# Altium project ADCS_Prototype.PrjPcb (part 2 of 2)

## Sheet Conversion3V3.SchDoc
size A3; SheetNumber: 5; SheetTotal: 9
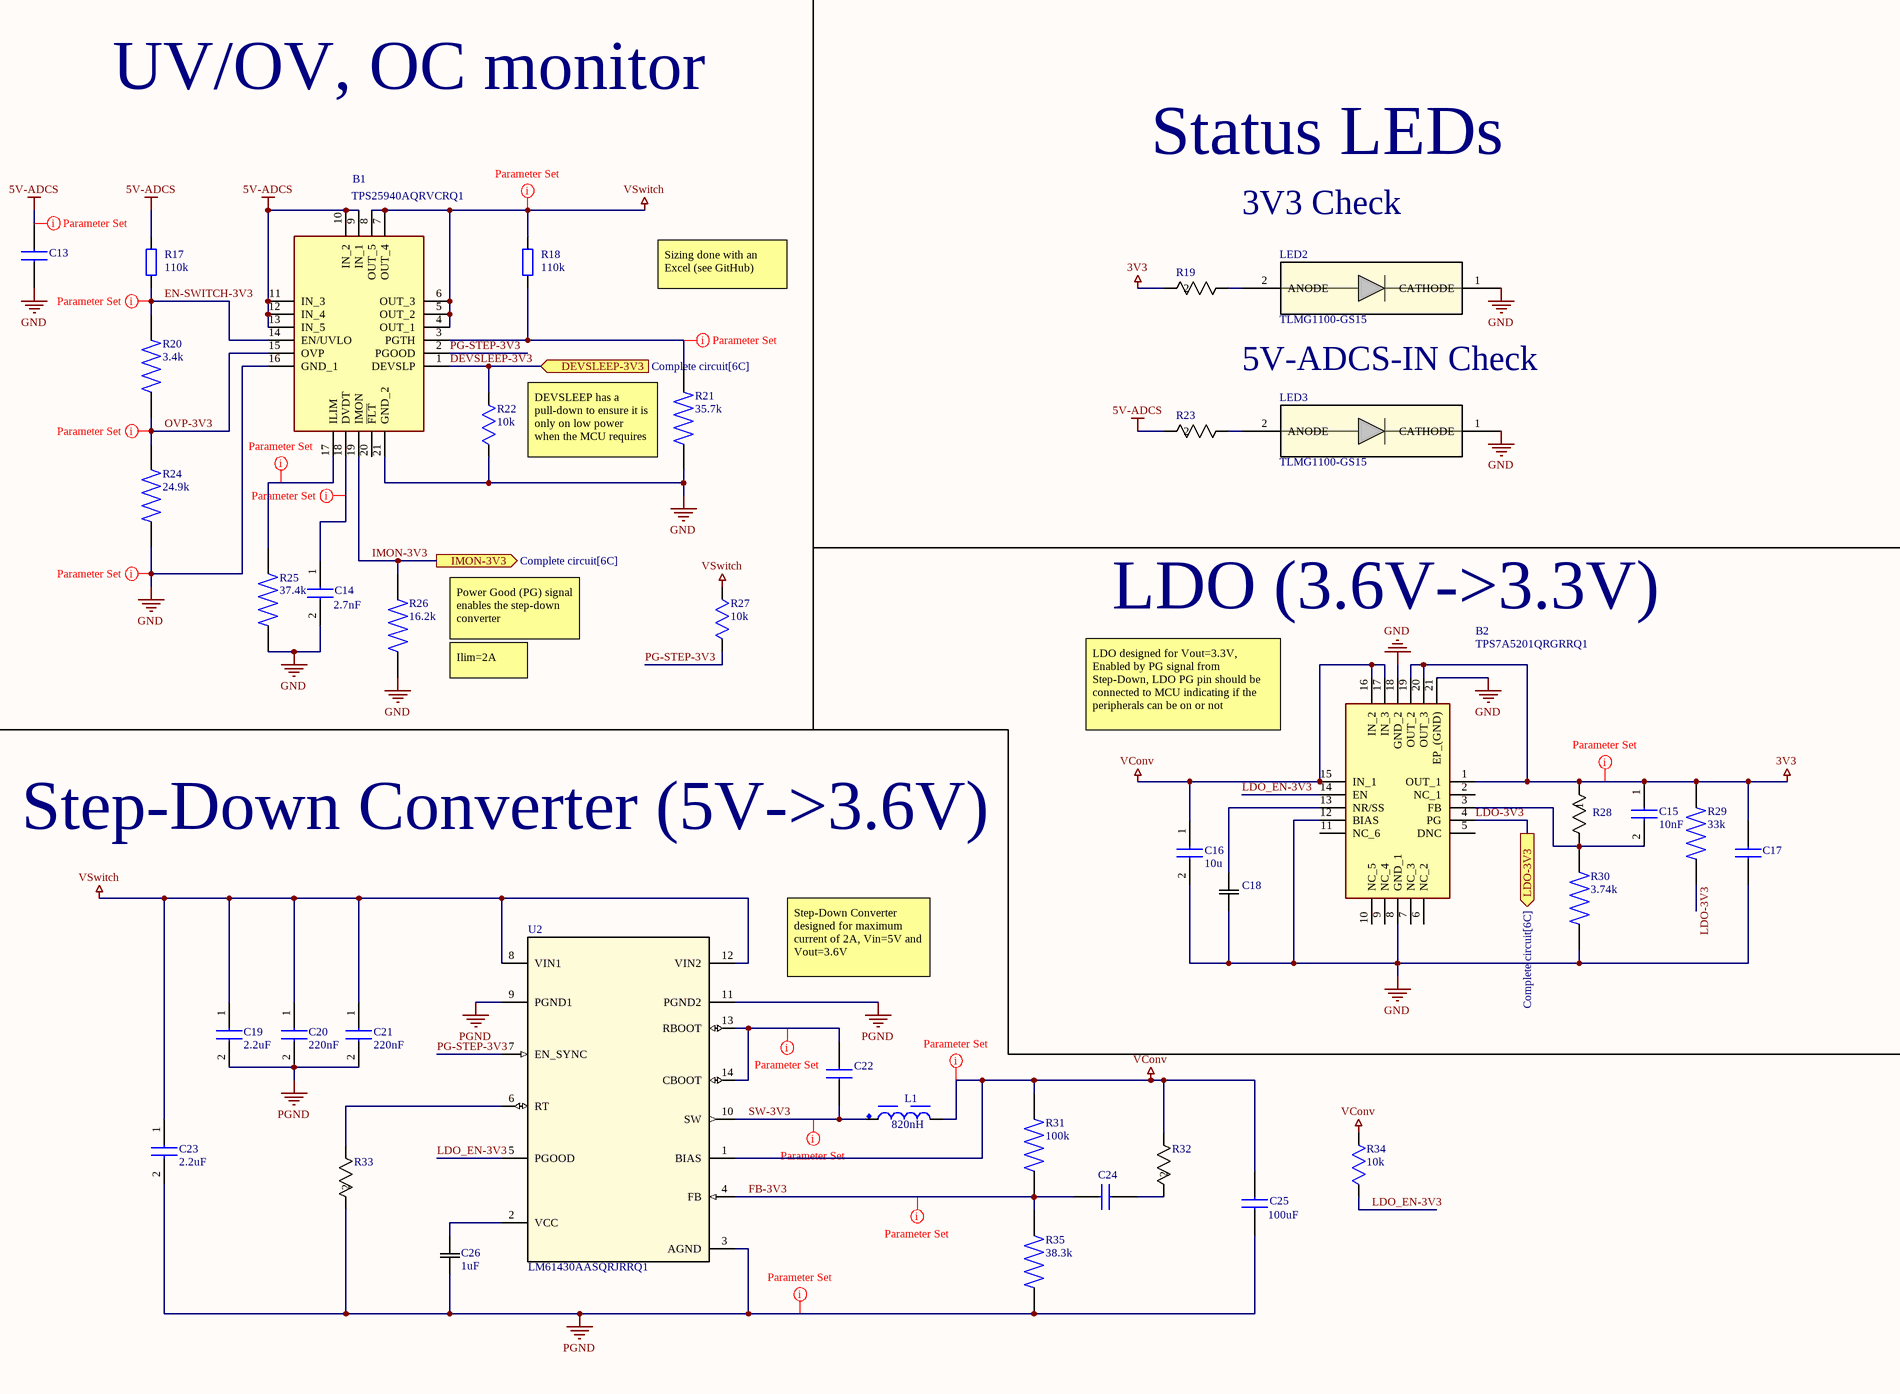
[diagram p7: Conversion3V3.SchDoc, right]

### Parts
B1  TPS25940AQRVCRQ1  [QFN50P300X400X80-21N]
B2  TPS7A5201QRGRRQ1  [QFN50P350X350X100-21N-D]
C13  C1206C104K3GACAUTO  [CAPC3216X180N]  (value not drawn)
C14  Capacitance: 2.7nF  [GCM188]  (hidden comment: GCM1885C1H272FA16J)
C15  Capacitance: 10nF  [C0805]  (hidden comment: C0805X103F5GACAUTO)
C16  Capacitance: 10u  [C0805]  (hidden comment: C0805X106J8RACAUTO)
C17  GCM31CR71A226KE02L  [CAPC3116X180N]  (value not drawn)
C18  C0603X103F3GACAUTO  [CAPC17795_95N_KEM]  (value not drawn)
C19  Capacitance: 2.2uF  [C0805]  (hidden comment: C0805X225J4RECAUTO)
C20  Capacitance: 220nF  [C1210_FT]  (hidden comment: C1210X224J3GACAUTO)
C21  Capacitance: 220nF  [C1210_FT]  (hidden comment: C1210X224J3GACAUTO)
C22  C1206C104K3GACAUTO  [CAPC3216X180N]  (value not drawn)
C23  Capacitance: 2.2uF  [C0805]  (hidden comment: C0805X225J4RECAUTO)
C24  06035A220F4T2A  [CAPC1608X90N]  (value not drawn)
C25  Capacitance: 100uF  [GRT32ER60J107ME13L]  (hidden comment: GRT32ER60J107ME13L)
C26  Capacitance: 1uF  [CAPC18095_95N_KEM]  (hidden comment: C0603X105J4RACAUTO)
L1  value 820nH  [WE-XHMI_4020]  (hidden comment: WE-XHMI_4020)
LED2  TLMG1100-GS15  [LED_0603_VIS]
LED3  TLMG1100-GS15  [LED_0603_VIS]
R17  value 110k  [WRIS-RSKS_0603_Reflow]  (hidden comment: 560112116148)
R18  value 110k  [WRIS-RSKS_0603_Reflow]  (hidden comment: 560112116148)
R19  MCT0603MD7502BP100  [RES_MCT_0603_VIS]  (value not drawn)
R20  value 3.4k  [RESC1508X60N]  (hidden comment: RQ73C1J3K4BTD)
R21  value 35.7k  [RES_ERJ-PB3B3572V]  (hidden comment: ERJ-PB3B3572V)
R22  value 10k  [RES_ERA3ARB103V]  (hidden comment: ERA3ARB103V)
R23  MCT0603MD7502BP100  [RES_MCT_0603_VIS]  (value not drawn)
R24  value 24.9k  [RESC1508X50N]  (hidden comment: RNCP0603FTD24K9)
R25  value 37.4k  [RESC1508X50N]  (hidden comment: RNCP0603FTD37K4)
R26  value 16.2k  [RESC1508X55N]  (hidden comment: RMCF0603FT16K2)
R27  value 10k  [RES_ERA3ARB103V]  (hidden comment: ERA3ARB103V)
R28  TNPW080511K8BEEN  [RES_TNPW0805_VIS]  (value not drawn)
R29  value 33k  [RESC1608X55N]  (hidden comment: RN73R1JTTD3302F10)
R30  value 3.74k  [RESC2012X55N]  (hidden comment: TNPW08053K74DEEA)
R31  value 100k  [RESC1608X55N]  (hidden comment: TNPU0603100KAZEN00)
R32  CRCW06031K00FKEA  [RES_CRCW_0603]  (value not drawn)
R33  CRCW06035K76FKEA  [RC0603N_VIS]  (value not drawn)
R34  value 10k  [RES_ERA3ARB103V]  (hidden comment: ERA3ARB103V)
R35  value 38.3k  [RES_ERJPA3F3832V]  (hidden comment: ERJPA3F3832V)
U2  LM61430AASQRJRRQ1  [RJR0014A-MFG]

### Ports
DEVSLEEP-3V3 (in, see Complete circuit[6C]), IMON-3V3 (out, see Complete circuit[6C]), LDO-3V3 (out, see Complete circuit[6C])

### Nets
3V3: B2.1(OUT_1) B2.19(OUT_2) B2.20(OUT_3) C15.1 C17.2 R19.2 R28.1 R29.2  [project net VDD]
5V-ADCS: B1.9(IN_1) B1.10(IN_2) B1.11(IN_3) B1.12(IN_4) B1.13(IN_5) C13.1 R17.1 R23.2
GND: B1.16(GND_1) B1.21(GND_2) B2.8(GND_1) B2.12(BIAS) B2.18(GND_2) B2.21(EP_(GND)) C13.2 C14.2 C16.2 C17.1 C18.1 LED2.1(CATHODE) LED3.1(CATHODE) R21.1 R22.1 R24.1 R25.1 R26.1 R30.1
PGND: C19.2 C20.2 C21.2 C23.2 C25.1 C26.1 R33.2 R35.1 U2.3(AGND) U2.9(PGND1) U2.11(PGND2)
VConv: B2.15(IN_1) B2.16(IN_2) B2.17(IN_3) C16.1 C25.2 L1.2 R31.2 R32.1 R34.2 U2.1(BIAS)
VSwitch: B1.4(OUT_1) B1.5(OUT_2) B1.6(OUT_3) B1.7(OUT_4) B1.8(OUT_5) C19.1 C20.1 C21.1 C23.1 R18.1 R27.1 U2.8(VIN1) U2.12(VIN2)
DEVSLEEP-3V3: B1.1(DEVSLP) R22.2 ; port DEVSLEEP-3V3
EN-SWITCH-3V3: B1.14(EN/UVLO) R17.2 R20.2
FB-3V3: C24.1 R31.1 R35.2 U2.4(FB)
IMON-3V3: B1.19(IMON) R26.2 ; port IMON-3V3
LDO-3V3: B2.4(PG) R29.1 ; port LDO-3V3
LDO_EN-3V3: B2.14(EN) R34.1 U2.5(PGOOD)
OVP-3V3: B1.15(OVP) R20.1 R24.2
PG-STEP-3V3: B1.2(PGOOD) R27.2 U2.7(EN_SYNC)
SW-3V3: C22.2 L1.1 U2.10(SW)
NetB1_3: B1.3(PGTH) R18.2 R21.2
NetB1_17: B1.17(ILIM) R25.2
NetB1_18: B1.18(DVDT) C14.1
NetB2_3: B2.3(FB) C15.2 R28.2 R30.2
NetB2_13: B2.13(NR/SS) C18.2
NetC22_1: C22.1 U2.13(RBOOT) U2.14(CBOOT)
NetC24_2: C24.2 R32.2
NetC26_2: C26.2 U2.2(VCC)
NetLED2_2: LED2.2(ANODE) R19.1
NetLED3_2: LED3.2(ANODE) R23.1
NetR33_1: R33.1 U2.6(RT)

Not connected (* = marked no-connect by the designer): B1 20(~{FLT}); B2 2(NC_1) 5(DNC) 6(NC_2) 7(NC_3) 9(NC_4) 10(NC_5) 11(NC_6)

### Layout directives
net class SupplyMax: 5V-ADCS, NetC22_1, SW-3V3
net class SupplyMin: (no net found under the mark), EN-SWITCH-3V3, FB-3V3, GND, NetB1_3, NetB1_17, NetB1_18, OVP-3V3, PGND, VConv, VDD, VSwitch

### Notes on the sheet
- UV/OV, OC monitor
- Status LEDs
- 3V3 Check
- Sizing done with an Excel (see GitHub)
- 5V-ADCS-IN Check
- DEVSLEEP has a pull-down to ensure it is only on low power when the MCU requires
- LDO (3.6V->3.3V)
- Power Good (PG) signal enables the step-down converter
- Ilim=2A
- LDO designed for Vout=3.3V, Enabled by PG signal from Step-Down, LDO PG pin should be connected to MCU indicating if the peripherals can be on or not
- Step-Down Converter (5V->3.6V)
- Step-Down Converter designed for maximum current of 2A, Vin=5V and Vout=3.6V

### Library data of the parts
B1 = CMP-011-00016-1: 2.7V-18V Automotive Current-Limited Load Switch with Current Sense & Short-to-Battery Protection; Manufacturer_Name: Texas Instruments; Geometry.Height: 0.8mm; Source: TPS25940AQRVCRQ1.SchLib; Datasheet Link: http://www.ti.com/lit/gpn/tps25940-q1; Design Item ID: TPS25940AQRVCRQ1; Mouser Price/Stock: https://www.mouser.co.uk/ProductDetail/Texas-Instruments/TPS25940AQRVCRQ1?qs=osPbIpHqQ9Uam0Tf4VM8lQ%3D%3D; Mouser Part Number: 595-TPS25940AQRVCRQ1; Manufacturer_Part_Number: TPS25940AQRVCRQ1
B2 = CMP-306-000000-1: Automotive 2A High-Accuracy Low-Noise Low-Dropout (LDO) Voltage Regulator; Manufacturer_Name: Texas Instruments; Geometry.Height: 1mm; Datasheet Link: http://www.ti.com/lit/gpn/tps7a52-q1; Mouser Price/Stock: https://www.mouser.co.uk/ProductDetail/Texas-Instruments/TPS7A5201QRGRRQ1?qs=1mbolxNpo8cdxsbFt%252By4TQ%3D%3D; Source: TPS7A5201QRGRRQ1.SchLib; Manufacturer_Part_Number: TPS7A5201QRGRRQ1; Mouser Part Number: 595-TPS7A5201QRGRRQ1; Design Item ID: TPS7A5201QRGRRQ1
C13 C22 = CMP-001-00115-2: SMD Auto C0G, Ceramic, 0.1 uF, 10%, 25 VDC, 62.5 VDC, 125C, -55C, C0G, SMD, MLCC, Ultra-Stable, Low Loss, Automotive Grade, 0.1 % , 10 GOhms, 36 mg, 1206, 3.2mm, 1.6mm, 1.6mm, 0.5mm, 2000, 78  Weeks, 120; Manufacturer_Name: KEMET; Geometry.Height: 1.8mm; Design Item ID: C1206C104K3GACAUTO; Manufacturer_Part_Number: C1206C104K3GACAUTO; Source: C1206C104K3GACAUTO.SchLib; Datasheet Link: https://content.kemet.com/datasheets/KEM_C1022_C0G_AUTO_SMD.pdf; Mouser Part Number: 80-C1206C104K3GAUTO; Mouser Price/Stock: https://www.mouser.co.uk/ProductDetail/KEMET/C1206C104K3GACAUTO?qs=iLbezkQI%252BsiL409OZdKKSA%3D%3D
C14 = GCM1885C1H272FA16J: Multilayer Ceramic Capacitors MLCC - SMD/SMT 2700 pF 50 VDC 1% 0603 C0G (NP0) AEC-Q200; Manufacturer_Name: Murata Electronics; Datasheet Link: https://search.murata.co.jp/Ceramy/image/img/A01X/G101/ENG/GCM1885C1H272FA16-01A.pdf; Height: 0.9mm; Manufacturer_Part_Number: GCM1885C1H272FA16J
C15 = C0805X103F5GACAUTO: Multilayer Ceramic Capacitors MLCC - SMD/SMT 50V 0.01uF C0G 0805 1% Flex AEC-Q200; Manufacturer_Name: Yageo Group; Datasheet Link: https://www.yageogroup.com/content/datasheet/asset/file/KEM_C1062_C0G_FT-CAP_SMD; Height: 1.1mm; Manufacturer_Part_Number: C0805X103F5GACAUTO; Mouser Part Number: 80-C0805X103F5GAUTO; Mouser Price/Stock: https://www.mouser.co.uk/ProductDetail/KEMET/C0805X103F5GACAUTO?qs=ds50AKTGxA8kafziiLAE7w%3D%3D
C16 = C0805X106J8RACAUTO: Multilayer Ceramic Capacitors MLCC - SMD/SMT 10 Vo 10 uF 0805 X7R 5 % AECQ200; Manufacturer_Name: Yageo Group; Datasheet Link: https://www.yageogroup.com/content/datasheet/asset/file/KEM_C1078_X7R_FT-CAP_AUTO_SMD; Height: 1.1mm; Manufacturer_Part_Number: C0805X106J8RACAUTO; Mouser Part Number: 80-C0805X106J8RAUTO; Mouser Price/Stock: https://www.mouser.co.uk/ProductDetail/KEMET/C0805X106J8RACAUTO?qs=HXFqYaX1Q2wKi4kcOiFe3g%3D%3D; Arrow Part Number: C0805X106J8RACAUTO; Arrow Price/Stock: https://www.arrow.com/en/products/c0805x106j8racauto/kemet-corporation
C17 = CMP-001-00127-1: Capacitor GCM31 L=3.2mm W=1.6mm T=1.6mm; Manufacturer_Name: Murata Electronics; Geometry.Height: 1.8mm; Mouser Price/Stock: https://www.mouser.co.uk/ProductDetail/Murata-Electronics/GCM31CR71A226KE02L?qs=9UHcxq0qN4vtutbd1jidnA%3D%3D; Source: GCM31CR71A226KE02L.SchLib; Datasheet Link: https://search.murata.co.jp/Ceramy/image/img/A01X/G101/ENG/GCM31CR71A226KE02-01A.pdf; Design Item ID: GCM31CR71A226KE02L; Manufacturer_Part_Number: GCM31CR71A226KE02L; Mouser Part Number: 81-GCM31CR71A226KE2L
C18 = CMP-001-00116-2: SMD Auto C0G Flex, Ceramic, 0.01 uF, 1%, 25 VDC, C0G, SMD, MLCC, FT-CAP, Ultra-Stable, Automotive Grade, 0603; Manufacturer_Name: Kemet; Copyright: Copyright (C) 2025 Ultra Librarian. All rights reserved.; Design Item ID: C0603X103F3GACAUTO; Manufacturer_Part_Number: C0603X103F3GACAUTO; Source: C0603X103F3GACAUTO.SchLib
C19 C23 = C0805X225J4RECAUTO: Capacitor; Manufacturer_Name: Yageo Group; Datasheet Link: https://www.yageogroup.com/content/datasheet/asset/file/KEM_C1090_X7R_ESD; Height: 1.1mm; Manufacturer_Part_Number: C0805X225J4RECAUTO; Mouser Part Number: 80-C0805X225J4RECAUT; Mouser Price/Stock: https://www.mouser.co.uk/ProductDetail/KEMET/C0805X225J4RECAUTO?qs=55YtniHzbhAubLJhOOO7lw%3D%3D; Arrow Part Number: C0805X225J4RECAUTO; Arrow Price/Stock: https://www.arrow.com/en/products/c0805x225j4recauto/kemet-corporation
C20 C21 = C1210X224J3GACAUTO: Multilayer Ceramic Capacitors MLCC - SMD/SMT 25V 0.22uF C0G 1210 5% Flex AEC-Q200; Manufacturer_Name: Yageo Group; Datasheet Link: https://www.yageogroup.com/content/datasheet/asset/file/KEM_C1062_C0G_FT-CAP_SMD; Manufacturer_Part_Number: C1210X224J3GACAUTO; Mouser Part Number: 80-C1210X224J3GAUTO; Mouser Price/Stock: https://www.mouser.co.uk/ProductDetail/KEMET/C1210X224J3GACAUTO?qs=gZXFycFWdAOsiS4yZkrXAg%3D%3D
C24 = CMP-001-00126-1: Multilayer Ceramic Capacitors MLCC - SMD/SMT 50V 22pF C0G 0603 1% Tol; Manufacturer_Name: Kyocera AVX; Geometry.Height: 0.9mm; Datasheet Link: https://componentsearchengine.com/Datasheets/1/06035A220F4T2A.pdf; Mouser Price/Stock: https://www.mouser.com/Search/Refine.aspx?Keyword=581-06035A220F4T2A; Manufacturer_Part_Number: 06035A220F4T2A; Source: 06035A220F4T2A.SchLib; Design Item ID: 06035A220F4T2A; Mouser Part Number: 581-06035A220F4T2A
C25 = CMP-001-00135-2: Multilayer Ceramic Capacitors MLCC - SMD/SMT 100 uF 6.3 VDC 20% 1210 X5R AEC-Q200; Manufacturer_Name: Murata Electronics; Geometry.Height: 2.7mm; Mouser Part Number: 81-GRT32ER60J107ME3L; Design Item ID: GRT32ER60J107ME13L; Manufacturer_Part_Number: GRT32ER60J107ME13L; Capacitor Type: Ceramic; Mouser Price/Stock: https://www.mouser.co.uk/ProductDetail/Murata-Electronics/GRT32ER60J107ME13L?qs=drgMNd%252BkGPOgdf3ISYHnDQ%3D%3D; Source: GRT32ER60J107ME13L.SchLib; Datasheet Link: https://search.murata.co.jp/Ceramy/image/img/A01X/G101/ENG/GRT32ER60J107ME13-01A.pdf
C26 = CMP-001-00117-3: SMD Auto X7R Flex, Ceramic, 1 uF, 5%, 16 VDC, X7R, SMD, MLCC, FT-CAP, Automotive Grade, 0603; Manufacturer_Name: Kemet; Copyright: Copyright (C) 2025 Ultra Librarian. All rights reserved.; Source: C0603X105J4RACAUTO.SchLib; Manufacturer_Part_Number: C0603X105J4RACAUTO; Design Item ID: C0603X105J4RACAUTO
L1 = CMP-006-00031-1: Size 4020; L = 0.82 ÂµH Â±20%; IR = 10.80 A; Isat = 11.60 A; RDCmax = 11.0 mâ„; MF: Wurth Elektronik; MP: 744393230082; Design Item ID: WE-XHMI_4020; Source: WE-XHMI_4020.SchLib; Case/Package: None; SnapEDA_Link: https://www.snapeda.com/parts/744393230082/Wurth+Electronics/view-part/?ref=snap; Component Type: Standard; Pins: 2; Check_prices: https://www.snapeda.com/parts/744393230082/Wurth+Electronics/view-part/?ref=eda
LED2 LED3 = CMP-007-00036-1: CHIPLED(SMD 0603-LED) GREEN U.BRIGHT-e4; Manufacturer_Name: Vishay; RefDes: RefDes; Copyright: Copyright (C) 2025 Ultra Librarian. All rights reserved.; Type: Type; Design Item ID: TLMG1100-GS15; Manufacturer_Part_Number: TLMG1100-GS15; Source: TLMG1100-GS15.SchLib
R17 R18 = CMP-009-00240-1: WRIS-RSKS Thick Film Resistor, size 0603, 110kO, +/-1%, 100mW; Manufacturer: Wurth Elektronik; Temperature Coefficient of Resistance Min: -100ppm/°C; Temperature Coefficient of Resistance Max: 100ppm/°C; Limiting Element Voltage: 75V; Length: 1.6mm; Rated Power: 100mW; Category: Thick Film Resistors; Resistance Tolerance: +/-1%; Source: WRIS-RSKS.SchLib; Height: 0.45mm; Case/Package: 0603; ComponentLink2Description: Datasheet Link; Match Code: WRIS-RSKS; Mount: Surface Mount; Width: 0.8mm; Packaging: Tape and Reel; Component Type: Standard; ComponentLink1URL: https://www.we-online.com/redexpert/article/560112116148?ad; Min Operating Temperature: -55°C; Design Item ID: 560112116148; Max Operating Temperature: 155°C; ComponentLink2URL: https://www.we-online.com/redexpert/spec/560112116148?ad; Pins: 2; ComponentLink1Description: Website Link; Manufacturer Part Number: 560112116148
R19 R23 = CMP-009-00216-2: MCT 0603-25 0.1% AT P1 75K; Manufacturer_Name: Vishay; Source: MCT0603MD7502BP100.SchLib; Copyright: Copyright (C) 2025 Ultra Librarian. All rights reserved.; Design Item ID: MCT0603MD7502BP100; Manufacturer_Part_Number: MCT0603MD7502BP100
R20 = CMP-009-00210-1: MP: RQ73C1J3K4BTD; Pins: 2; Source: RQ73C1J3K4BTD.SchLib; Price: None; Availability: Unavailable; Design Item ID: RQ73C1J3K4BTD; Component Type: Standard; Case/Package: None
R21 = CMP-009-00261-1: Series/Type: High Precision Thick Film Chip Resistors , Power Rating (W): 0.2, Chip Size (LxW(EIA)) (mm): 1.6 x 0.8 (EIA:0603), Resistance Values (â„; MF: Panasonic; MP: ERJ-PB3B3572V; Check_prices: https://www.snapeda.com/parts/ERJ-PB3B3572V/Panasonic/view-part/?ref=eda; Component Type: Standard; Case/Package: 603-2 Panasonic; Source: ERJ-PB3B3572V.SchLib; SnapEDA_Link: https://www.snapeda.com/parts/ERJ-PB3B3572V/Panasonic/view-part/?ref=snap; Pins: 2; Design Item ID: ERJ-PB3B3572V
R22 R27 R34 = CMP-009-00245-3: Thin Film Resistors - SMD 0603 10Kohm 0.1% 10ppm AEC-Q200; Design Item ID: ERA3ARB103V; Case/Package: None; Pins: 2; Source: ERA3ARB103V.SchLib; Component Type: Standard; MP: ERA3ARB103V; Availability: Unavailable; Price: None
R24 = CMP-009-00241-1: Res Thin Film 0603 24.9K Ohm 1% 0.125W(1/8W) Â±100ppm/C Sulfur Resistant Pad SMD T/R; MF: Stackpole Electronics Inc; Pins: 2; Case/Package: 1508 Stackpole; MP: RNCP0603FTD24K9; SnapEDA_Link: https://www.snapeda.com/parts/RNCP0603FTD24K9/Stackpole+Electronics/view-part/?ref=snap; Design Item ID: RNCP0603FTD24K9; Source: RNCP0603FTD24K9.SchLib; Component Type: Standard; Check_prices: https://www.snapeda.com/parts/RNCP0603FTD24K9/Stackpole+Electronics/view-part/?ref=eda
R25 = CMP-009-00243-2: 37.4 kOhms ±1% 0.125W, 1/8W Chip Resistor 0603 (1608 Metric) Anti-Sulfur Thin Film; MP: RNCP0603FTD37K4; Component Type: Standard; Pins: 2; Case/Package: None; Availability: Unavailable; Source: RNCP0603FTD37K4.SchLib; Design Item ID: RNCP0603FTD37K4; Price: None
R26 = CMP-009-00266-2: 16.2 kOhms ±1% 0.1W, 1/10W Chip Resistor 0603 (1608 Metric) Automotive AEC-Q200 Thick Film; Component Type: Standard; Pins: 2; Design Item ID: RMCF0603FT16K2; Source: RMCF0603FT16K2.SchLib; Availability: Unavailable; MP: RMCF0603FT16K2; Price: None; Case/Package: None
R28 = CMP-009-00233-2: TNPW0805 11K8 0.1% T-9 E52 e3; Manufacturer_Name: Vishay; Datasheet: https://www.vishay.com/doc?28758; Source: TNPW080511K8BEEN.SchLib; Copyright: Copyright (C) 2026 Ultra Librarian. All rights reserved.; Design Item ID: TNPW080511K8BEEN; Manufacturer_Part_Number: TNPW080511K8BEEN
R29 = CMP-009-00222-1: 33 kOhms Â±1% 0.125W, 1/8W Chip Resistor 0603 (1608 Metric) Automotive AEC-Q200, Moisture Resistant Thin Film; MF: KOA Speer; MP: RN73R1JTTD3302F10; Component Type: Standard; Check_prices: https://www.snapeda.com/parts/RN73R1JTTD3302F10/KOA+Speer/view-part/?ref=eda; Source: RN73R1JTTD3302F10.SchLib; Case/Package: 603 KOA; Pins: 2; Design Item ID: RN73R1JTTD3302F10; SnapEDA_Link: https://www.snapeda.com/parts/RN73R1JTTD3302F10/KOA+Speer/view-part/?ref=snap
R30 = CMP-009-00234-1: TNPW0805 3K74 0.5% T-9 ET1 E3; Component Type: Standard; Pins: 2; Availability: Unavailable; Source: TNPW08053K74DEEA.SchLib; Design Item ID: TNPW08053K74DEEA; Case/Package: None; MP: TNPW08053K74DEEA; Price: None
R31 = CMP-009-00208-1: 100 kOhms Â±0.05% 0.1W, 1/10W Chip Resistor 0603 (1608 Metric) Anti-Sulfur, Automotive AEC-Q200, Moisture Resistant Thin Film; MF: Vishay; MP: TNPU0603100KAZEN00; Component Type: Standard; Pins: 2; SnapEDA_Link: https://www.snapeda.com/parts/TNPU0603100KAZEN00/Vishay/view-part/?ref=snap; Design Item ID: TNPU0603100KAZEN00; Source: TNPU0603100KAZEN00.SchLib; Case/Package: 1608 Vishay; Check_prices: https://www.snapeda.com/parts/TNPU0603100KAZEN00/Vishay/view-part/?ref=eda
R32 = CMP-009-00227-2: D11/CRCW0603 100 1K 1% ET1 e3; Manufacturer_Name: Vishay; Source: CRCW06031K00FKEA.SchLib; Copyright: Copyright (C) 2026 Ultra Librarian. All rights reserved.; Design Item ID: CRCW06031K00FKEA; Manufacturer_Part_Number: CRCW06031K00FKEA
R33 = CMP-009-00232-2: D11/CRCW0603 100 5K76 1% ET1 e3; Manufacturer_Name: Vishay; Manufacturer_Part_Number: CRCW06035K76FKEA; Design Item ID: CRCW06035K76FKEA; Datasheet: https://www.vishay.com/doc?20035; Source: CRCW06035K76FKEA.SchLib; Copyright: Copyright (C) 2026 Ultra Librarian. All rights reserved.
R35 = CMP-009-00273-1: Res, Aec-Q200, Thick Film, 38K3, 0603; MP: ERJ-PA3F3832V; MF: Panasonic; Pins: 2; Check_prices: https://www.snapeda.com/parts/ERJ-PA3F3832V/Panasonic/view-part/?ref=eda; Component Type: Standard; Case/Package: 1608-2 Panasonic; SnapEDA_Link: https://www.snapeda.com/parts/ERJ-PA3F3832V/Panasonic/view-part/?ref=snap; Source: ERJPA3F3832V.SchLib; Design Item ID: ERJPA3F3832V
U2 = CMP-226-000001-2: Automotive 3-V to 36-V, 3-A, low-noise synchronous step-down converter 14-VQFN-HR -40 to 150; Manufacturer_Name: Texas Instruments; Copyright: Copyright (C) 2026 Ultra Librarian. All rights reserved.; Design Item ID: LM61430AASQRJRRQ1; RefDes: RefDes; TYPE: TYPE; Manufacturer_Part_Number: LM61430AASQRJRRQ1; Source: LM61430AASQRJRRQ1.SchLib

## Sheet Connectors.SchDoc
size A3; SheetNumber: 7; SheetTotal: 9
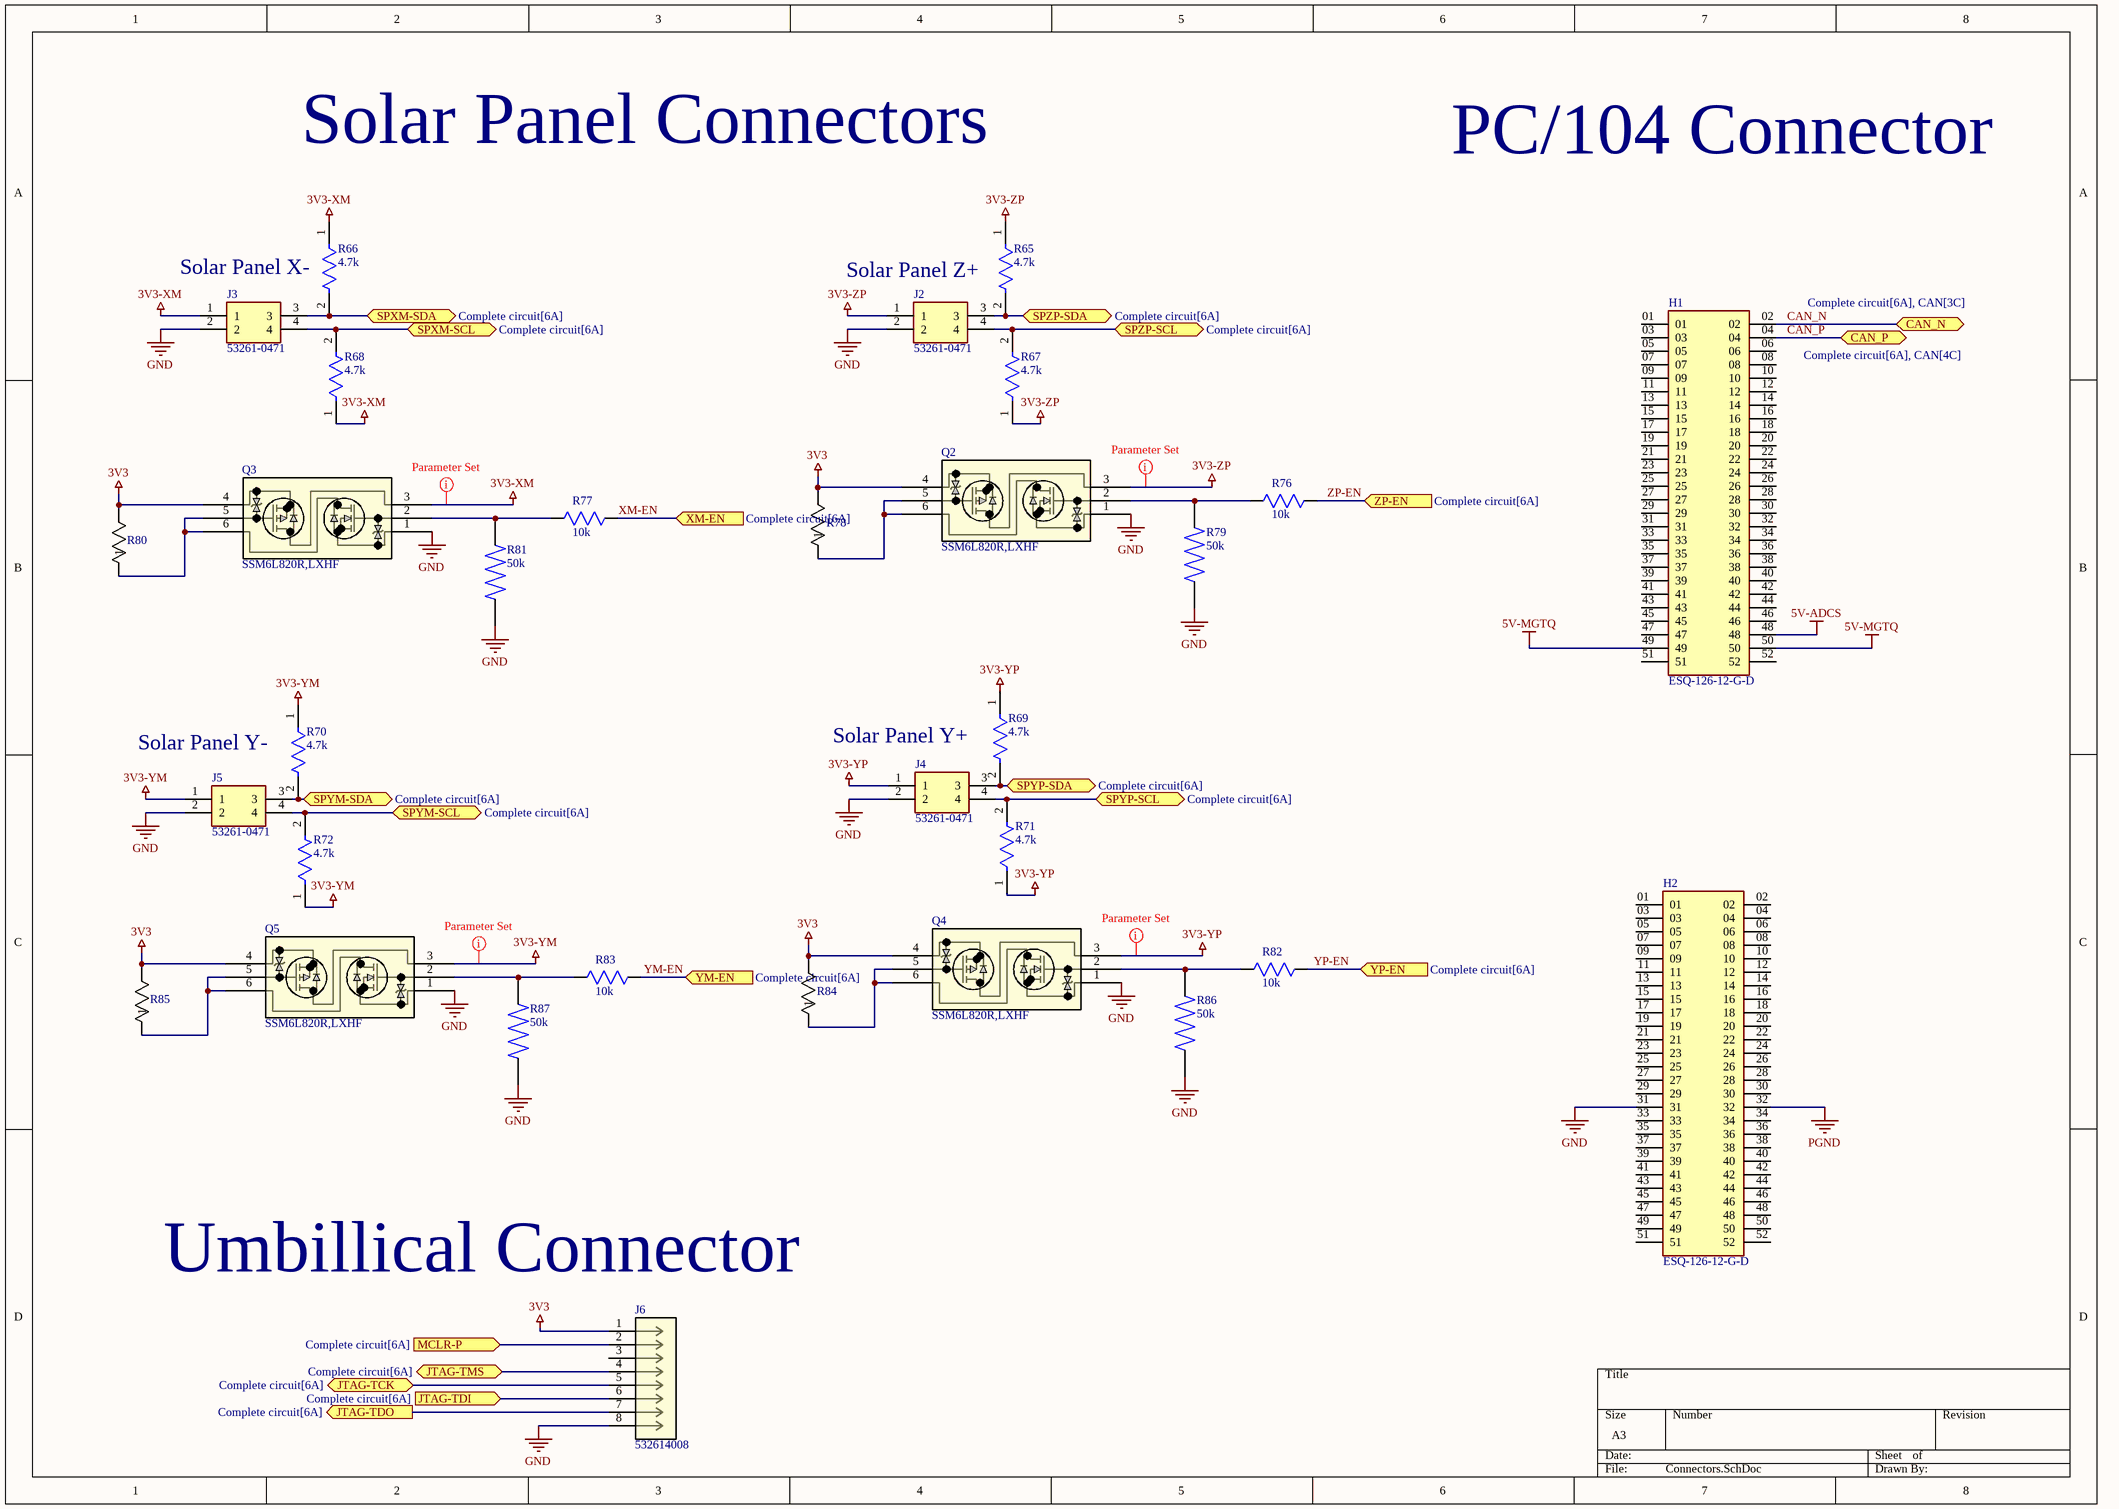
[diagram p8: Connectors.SchDoc]

### Parts
H1  ESQ-126-12-G-D  [SAMTEC_ESQ-126-12-G-D]
H2  ESQ-126-12-G-D  [SAMTEC_ESQ-126-12-G-D]
J2  53261-0471  [53261-0471]
J3  53261-0471  [53261-0471]
J4  53261-0471  [53261-0471]
J5  53261-0471  [53261-0471]
J6  532614008  [CONN_532610000-SD_08_MOL]
Q2  SSM6L820R,LXHF  [TSOP6F_TOS]
Q3  SSM6L820R,LXHF  [TSOP6F_TOS]
Q4  SSM6L820R,LXHF  [TSOP6F_TOS]
Q5  SSM6L820R,LXHF  [TSOP6F_TOS]
R65  value 4.7k  [FP-RG1608-IPC_C]  (hidden comment: RG1608N-472-D-T5)
R66  value 4.7k  [FP-RG1608-IPC_C]  (hidden comment: RG1608N-472-D-T5)
R67  value 4.7k  [FP-RG1608-IPC_C]  (hidden comment: RG1608N-472-D-T5)
R68  value 4.7k  [FP-RG1608-IPC_C]  (hidden comment: RG1608N-472-D-T5)
R69  value 4.7k  [FP-RG1608-IPC_C]  (hidden comment: RG1608N-472-D-T5)
R70  value 4.7k  [FP-RG1608-IPC_C]  (hidden comment: RG1608N-472-D-T5)
R71  value 4.7k  [FP-RG1608-IPC_C]  (hidden comment: RG1608N-472-D-T5)
R72  value 4.7k  [FP-RG1608-IPC_C]  (hidden comment: RG1608N-472-D-T5)
R76  value 10k  [RES_ERA3ARB103V]  (hidden comment: ERA3ARB103V)
R77  value 10k  [RES_ERA3ARB103V]  (hidden comment: ERA3ARB103V)
R78  CRCW060310K0DHEAP  [RC0603N_VIS]  (value not drawn)
R79  value 50k  [RESC1608X55N]  (hidden comment: TNPU060350K0HZEN00)
R80  CRCW060310K0DHEAP  [RC0603N_VIS]  (value not drawn)
R81  value 50k  [RESC1608X55N]  (hidden comment: TNPU060350K0HZEN00)
R82  value 10k  [RES_ERA3ARB103V]  (hidden comment: ERA3ARB103V)
R83  value 10k  [RES_ERA3ARB103V]  (hidden comment: ERA3ARB103V)
R84  CRCW060310K0DHEAP  [RC0603N_VIS]  (value not drawn)
R85  CRCW060310K0DHEAP  [RC0603N_VIS]  (value not drawn)
R86  value 50k  [RESC1608X55N]  (hidden comment: TNPU060350K0HZEN00)
R87  value 50k  [RESC1608X55N]  (hidden comment: TNPU060350K0HZEN00)

### Ports
CAN_N (bidir, see Complete circuit[6A], CAN[3C]), CAN_P (bidir, see Complete circuit[6A], CAN[4C]), JTAG-TCK (bidir, see Complete circuit[6A]), JTAG-TDI (in, see Complete circuit[6A]), JTAG-TDO (out, see Complete circuit[6A]), JTAG-TMS (bidir, see Complete circuit[6A]), MCLR-P (in, see Complete circuit[6A]), SPXM-SCL (bidir, see Complete circuit[6A]), SPXM-SDA (bidir, see Complete circuit[6A]), SPYM-SCL (bidir, see Complete circuit[6A]), SPYM-SDA (bidir, see Complete circuit[6A]), SPYP-SCL (bidir, see Complete circuit[6A]), SPYP-SDA (bidir, see Complete circuit[6A]), SPZP-SCL (bidir, see Complete circuit[6A]), SPZP-SDA (bidir, see Complete circuit[6A]), XM-EN (in, see Complete circuit[6A]), YM-EN (in, see Complete circuit[6A]), YP-EN (in, see Complete circuit[6A]), ZP-EN (in, see Complete circuit[6A])

### Nets
3V3: J6.1 Q2.4 Q3.4 Q4.4 Q5.4 R78.2 R80.2 R84.2 R85.2  [project net VDD]
3V3-XM: J3.1 Q3.3 R66.1 R68.1
3V3-YM: J5.1 Q5.3 R70.1 R72.1
3V3-YP: J4.1 Q4.3 R69.1 R71.1
3V3-ZP: J2.1 Q2.3 R65.1 R67.1
5V-ADCS: H1.48
5V-MGTQ: H1.49 H1.50
GND: H2.31 J2.2 J3.2 J4.2 J5.2 J6.8 Q2.1 Q3.1 Q4.1 Q5.1 R79.1 R81.1 R86.1 R87.1
PGND: H2.32
CAN_N: H1.02 ; port CAN_N
CAN_P: H1.04 ; port CAN_P
JTAG-TCK: J6.5 ; port JTAG-TCK
JTAG-TDI: J6.6 ; port JTAG-TDI
JTAG-TDO: J6.7 ; port JTAG-TDO
JTAG-TMS: J6.4 ; port JTAG-TMS
MCLR-P: J6.2 ; port MCLR-P
SPXM-SCL: J3.4 R68.2 ; port SPXM-SCL
SPXM-SDA: J3.3 R66.2 ; port SPXM-SDA
SPYM-SCL: J5.4 R72.2 ; port SPYM-SCL
SPYM-SDA: J5.3 R70.2 ; port SPYM-SDA
SPYP-SCL: J4.4 R71.2 ; port SPYP-SCL
SPYP-SDA: J4.3 R69.2 ; port SPYP-SDA
SPZP-SCL: J2.4 R67.2 ; port SPZP-SCL
SPZP-SDA: J2.3 R65.2 ; port SPZP-SDA
XM-EN: R77.2 ; port XM-EN
YM-EN: R83.2 ; port YM-EN
YP-EN: R82.2 ; port YP-EN
ZP-EN: R76.2 ; port ZP-EN
NetQ2_2: Q2.2 R76.1 R79.2
NetQ2_5: Q2.5 Q2.6 R78.1
NetQ3_2: Q3.2 R77.1 R81.2
NetQ3_5: Q3.5 Q3.6 R80.1
NetQ4_2: Q4.2 R82.1 R86.2
NetQ4_5: Q4.5 Q4.6 R84.1
NetQ5_2: Q5.2 R83.1 R87.2
NetQ5_5: Q5.5 Q5.6 R85.1

Not connected (* = marked no-connect by the designer): H1 01 03 05 06 07 08 09 10 11 12 13 14 15 16 17 18 19 20 21 22 23 24 25 26 27 28 29 30 31 32 33 34 35 36 37 38 39 40 41 42 43 44 45 46 47 51 52; H2 01 02 03 04 05 06 07 08 09 10 11 12 13 14 15 16 17 18 19 20 21 22 23 24 25 26 27 28 29 30 33 34 35 36 37 38 39 40 41 42 43 44 45 46 47 48 49 50 51 52; J6 3

### Layout directives
net class SupplyMin: 3V3-XM, 3V3-YM, 3V3-YP, 3V3-ZP

### Notes on the sheet
- Solar Panel Connectors
- PC/104 Connector
- (near R66) Solar Panel X-
- (near R65) Solar Panel Z+
- (near R70) Solar Panel Y-
- (near R69) Solar Panel Y+
- (near J6) Umbillical Connector

### Library data of the parts
H1 H2 = CMP-002-00072-1: Source: ESQ-126-12-G-D.SchLib; Price: None; Case/Package: None; MP: ESQ-126-12-G-D; Value: *; Availability: Unavailable; Pins: 52; Design Item ID: ESQ-126-12-G-D; Component Type: Standard
J2-J5 = 53261-0471: Connector; Manufacturer_Name: Molex; Datasheet Link: http://www.molex.com/webdocs/datasheets/pdf/en-us//0532610471_PCB_HEADERS.pdf; Manufacturer_Part_Number: 53261-0471; Mouser Part Number: 538-53261-0471; Mouser Price/Stock: https://www.mouser.co.uk/ProductDetail/Molex/53261-0471?qs=%252B72YyncTwW9e3et3PwnEMw%3D%3D; Arrow Part Number: 53261-0471; Arrow Price/Stock: null?region=nac
J6 = CMP-002-00084-1: 1.25mm Pitch, PicoBlade PCB Header, Single Row, Right-Angle, Surface Mount, Gold (Au) Flash Plating, Friction Lock, 8 Circuits, Natural, Tape and Reel; Manufacturer_Name: Molex Connector Corporation; Manufacturer_Part_Number: 532614008; RefDes: RefDes; Design Item ID: 532614008; Copyright: Copyright (C) 2026 Ultra Librarian. All rights reserved.; Type: Type; Source: 532614008.SchLib
Q2-Q5 = CMP-382-000000-1: N-ch + P-ch MOSFET, 30 V/-20 V, 4 A/-4 A, 0.0391 Î©@4.5V/0.045 Î©@10V, TSOP6F; Manufacturer_Name: Toshiba Electronic Devices & Storage Corp.; Datasheet: https://toshiba.semicon-storage.com/info/docget.jsp?did=63678&prodName=SSM6L820R; Type: Type; Design Item ID: SSM6L820R,LXHF; Copyright: Copyright (C) 2026 Ultra Librarian. All rights reserved.; RefDes: RefDes; Manufacturer_Part_Number: SSM6L820R,LXHF; Source: SSM6L820R,LXHF.SchLib
R65-R72 = CMP-009-00179-2: Fixed Resistor, Thin Film, 0.1W, 4700ohm, 100V, 0.5% +/-Tol, 10ppm/Cel, Surface Mount, 0603; Additional Feature: ANTI-SULFUR, PRECISION; Package Height: 0.4mm; Temperature Coefficient (ppm/Cel): 10; Reference Standard: AEC-Q200; Package Length: 1.6mm; Rated Temperature: 70°C; Package Width: 0.8mm; Power: 166.7mW; Mounting Technology: Surface Mount; JESD-609 Code: e3; Packaging: Tape and Reel; Min Operating Temperature: -55°C; Working Voltage: 100V; Reach SVHC Compliant: Yes; Construction: Rectangular; RoHS Compliant: Yes; Termination: Wraparound; Pins: 2; Resistor Type: FIXED RESISTOR; Tolerance: 0.5%; Max Operating Temperature: 155°C; Terminal Finish: Tin; Case/Package: 0603; Technology: THIN FILM
R76 R77 R82 R83 = CMP-009-00245-3: as R22 on sheet Conversion3V3; Design Item ID: ERA3ARB103V; Case/Package: None; Pins: 2; Source: ERA3ARB103V.SchLib; Component Type: Standard; MP: ERA3ARB103V; Availability: Unavailable; Price: None
R78 R80 R84 R85 = CMP-009-00226-2: D11/CRCW0603-P 50 10K 0.5% ET1 e3; Manufacturer_Name: Vishay; Manufacturer_Part_Number: CRCW060310K0DHEAP; Copyright: Copyright (C) 2026 Ultra Librarian. All rights reserved.; Datasheet: https://www.vishay.com/doc?20036; Design Item ID: CRCW060310K0DHEAP; Source: CRCW060310K0DHEAP.SchLib
R79 R81 R86 R87 = CMP-009-00220-1: 50 kOhms Â±0.02% 0.1W, 1/10W Chip Resistor 0603 (1608 Metric) Anti-Sulfur, Automotive AEC-Q200, Moisture Resistant Thin Film; MF: Vishay; Check_prices: https://www.snapeda.com/parts/TNPU060350K0HZEN00/Vishay/view-part/?ref=eda; SnapEDA_Link: https://www.snapeda.com/parts/TNPU060350K0HZEN00/Vishay/view-part/?ref=snap; Component Type: Standard; Design Item ID: TNPU060350K0HZEN00; Source: TNPU060350K0HZEN00.SchLib; MP: TNPU060350K0HZEN00; Case/Package: 1608 Vishay; Pins: 2

## Sheet Memory.SchDoc
size A4; SheetNumber: 8; SheetTotal: 9
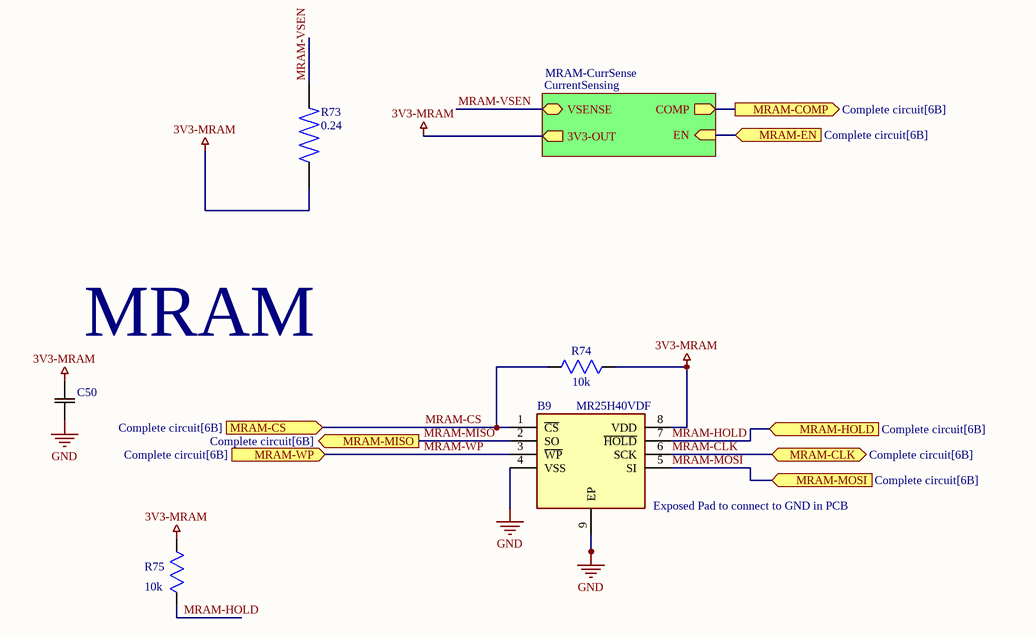
[diagram p9: Memory.SchDoc]

### Parts
B9  MR25H40VDF  [SON127P600X500X90-9N-D]
C50  C1206C104J4GACAUTO  [CAPC340180_180N_KEM]  (value not drawn)
R73  value 0.24  [RES_ERJ3BQFR24V]  (hidden comment: ERJ3BQFR24V)
R74  value 10k  [RES_ERA3ARB103V]  (hidden comment: ERA3ARB103V)
R75  value 10k  [RES_ERA3ARB103V]  (hidden comment: ERA3ARB103V)

### Sub-sheets
MRAM-CurrSense = CurrentSensing: VSENSE (bidir), 3V3-OUT (out), COMP (out), EN (in)

### Ports
MRAM-CLK (bidir, see Complete circuit[6B]), MRAM-COMP (out, see Complete circuit[6B]), MRAM-CS (in, see Complete circuit[6B]), MRAM-EN (in, see Complete circuit[6B]), MRAM-HOLD (in, see Complete circuit[6B]), MRAM-MISO (out, see Complete circuit[6B]), MRAM-MOSI (in, see Complete circuit[6B]), MRAM-WP (in, see Complete circuit[6B])

### Nets
3V3-MRAM: B9.8(VDD) C50.2 R73.1 R74.2 R75.1 ; sheet MRAM-CurrSense/3V3-OUT
GND: B9.4(VSS) B9.9(EP) C50.1
MRAM-CLK: B9.6(SCK) ; port MRAM-CLK
MRAM-COMP: port MRAM-COMP, sheet MRAM-CurrSense/COMP
MRAM-CS: B9.1(~{CS}) R74.1 ; port MRAM-CS
MRAM-EN: port MRAM-EN, sheet MRAM-CurrSense/EN
MRAM-HOLD: B9.7(~{HOLD}) R75.2 ; port MRAM-HOLD
MRAM-MISO: B9.2(SO) ; port MRAM-MISO
MRAM-MOSI: B9.5(SI) ; port MRAM-MOSI
MRAM-VSEN: R73.2 ; sheet MRAM-CurrSense/VSENSE
MRAM-WP: B9.3(~{WP}) ; port MRAM-WP

### Notes on the sheet
- (near C50) MRAM
- (near B9) Exposed Pad to connect to GND in PCB

### Library data of the parts
B9 = CMP-071-000002-1: MRAM 4Mb 3.3V 512Kx8 SPI MRAM; Manufacturer_Name: Everspin Technologies; Geometry.Height: 0.9mm; __ORIG_LIFECYCLESTATEGUID__: 706004B5-C76E-482E-903B-BA0E4FAE086A; Design Item ID: MR25H40VDF; Manufacturer_Part_Number: MR25H40VDF; Source: MR25H40VDF.SchLib; Datasheet Link: https://www.everspin.com/getdatasheet/MR25H40; Mouser Part Number: 936-MR25H40VDF; Mouser Price/Stock: https://www.mouser.co.uk/ProductDetail/Everspin-Technologies/MR25H40VDF?qs=wUXugUrL1qy8G9iN6Ia%2F%2FQ%3D%3D
C50 = CMP-001-00131-4: SMD Auto C0G, Ceramic, 0.1 uF, 5%, 16 VDC, C0G, SMD, MLCC, Ultra-Stable, Low Loss, Automotive Grade, 1206; Manufacturer_Name: Kemet; Copyright: Copyright (C) 2025 Ultra Librarian. All rights reserved.; Manufacturer_Part_Number: C1206C104J4GACAUTO; Source: C1206C104J4GACAUTO.SchLib; Design Item ID: C1206C104J4GACAUTO
R73 = CMP-009-00269-1: Res Thick Film 0603 0.24 Ohm 1% 0.25W(1/4W) 300ppm/C Pad SMD Automotive T/R; MP: ERJ-3BQFR24V; MF: Panasonic; Case/Package: 1608-2 Panasonic; Source: ERJ3BQFR24V.SchLib; Check_prices: https://www.snapeda.com/parts/ERJ-3BQFR24V/Panasonic/view-part/?ref=eda; Component Type: Standard; Pins: 2; SnapEDA_Link: https://www.snapeda.com/parts/ERJ-3BQFR24V/Panasonic/view-part/?ref=snap; Design Item ID: ERJ3BQFR24V
R74 R75 = CMP-009-00245-3: as R22 on sheet Conversion3V3; Design Item ID: ERA3ARB103V; Case/Package: None; Pins: 2; Source: ERA3ARB103V.SchLib; Component Type: Standard; MP: ERA3ARB103V; Availability: Unavailable; Price: None

## Nets that join several sheets
3V3-CAN: CAN (5 pins), CAN/CAN-CurrSense (B6A.3)
3V3-IMU: Sensors (6 pins), SEN/IMU-CurrSense (B6C.3)
3V3-MGN: Sensors (B4.8 R48.1), SEN/MGN-CurrSense (B6D.3)
3V3-MRAM: Memory (5 pins), MEM/MRAM-CurrSense (B6B.3)
5V: FIL1 (C39A.2 C40A.2 U4A.2 U4A.11), FIL2 (C39B.2 C40B.2 U4B.2 U4B.11), FIL3 (C39C.2 C40C.2 U4C.2 U4C.11), Conversion5V (9 pins)
5V-ADCS: Conversion3V3 (8 pins), Connectors (H1.48)
5V-MGTQ: Conversion5V (8 pins), Connectors (H1.49 H1.50)
GND: Complete circuit (34 pins), FIL1 (R49A.2 R55A.1), FIL2 (R49B.2 R55B.1), FIL3 (R49C.2 R55C.1), CAN (B8.2 C47.2 C48.1 C49.2), CAN/CAN-CurrSense (9 pins), Sensors (11 pins), SEN/IMU-CurrSense (9 pins), SEN/MGN-CurrSense (9 pins), Conversion5V (14 pins), Conversion3V3 (19 pins), Connectors (14 pins), Memory (B9.4 B9.9 C50.1), MEM/MRAM-CurrSense (9 pins)
PGND: FIL1 (12 pins), FIL2 (12 pins), FIL3 (12 pins), Conversion3V3 (11 pins), Connectors (H2.32)
VDD: Complete circuit (24 pins), FIL1 (R53A.1), FIL2 (R53B.1), FIL3 (R53C.1), CAN/CAN-CurrSense (7 pins), Sensors (B5.1 C33.1), SEN/IMU-CurrSense (7 pins), SEN/MGN-CurrSense (7 pins), Conversion3V3 (8 pins), Connectors (9 pins), MEM/MRAM-CurrSense (7 pins)
MGN-CLK: Complete circuit (U1.76), Sensors (B4.1)
CAN-COMP: Complete circuit (U1.71), CAN/CAN-CurrSense (B7A.1 U5A.1)
CAN-EN: Complete circuit (U1.68), CAN/CAN-CurrSense (B7A.2 R58A.2)
CAN-FAULT: Complete circuit (U1.66), CAN (B8.5 R64.2)
CAN-RX: Complete circuit (U1.67), CAN (B8.4)
CAN-S: Complete circuit (U1.70), CAN (B8.8)
CAN-TX: Complete circuit (U1.69), CAN (B8.1)
CAN_N: CAN (B8.6 R63.1), Connectors (H1.02)
CAN_P: CAN (B8.7 R62.1), Connectors (H1.04)
CAN_VSEN: CAN (R61.2), CAN/CAN-CurrSense (B6A.1 Q1A.3)
DEVSLEEP-3V3: Complete circuit (U1.1), Conversion3V3 (B1.1 R22.2)
DEVSLEEP-5V: Complete circuit (U1.99), Conversion5V (B3.1 R42.2)
IMON-3V3: Complete circuit (U1.2), Conversion3V3 (B1.19 R26.2)
IMON-5V: Complete circuit (U1.100), Conversion5V (B3.19 R45.2)
IMU-CLK: Complete circuit (U1.43), Sensors (U3.13)
IMU-COMP: Complete circuit (U1.41), SEN/IMU-CurrSense (B7C.1 U5C.1)
IMU-CS: Complete circuit (U1.44), Sensors (U3.12)
IMU-EN: Complete circuit (U1.56), SEN/IMU-CurrSense (B7C.2 R58C.2)
IMU-INT1: Complete circuit (U1.42), Sensors (U3.4)
IMU-INT2: Complete circuit (U1.50), Sensors (U3.9)
IMU-MISO: Complete circuit (U1.47), Sensors (U3.1)
IMU-MOSI: Complete circuit (U1.48), Sensors (U3.14)
IMU_VSEN: Sensors (R47.2), SEN/IMU-CurrSense (B6C.1 Q1C.3)
ISEN_IFB: Complete circuit (U1.16), FIL3 (5 pins)
ISEN_IFB: Complete circuit (U1.21), FIL1 (5 pins)
ISEN_IFB: Complete circuit (U1.28), FIL2 (5 pins)
JTAG-TCK: Complete circuit (U1.38), Connectors (J6.5)
JTAG-TDI: Complete circuit (U1.39), Connectors (J6.6)
JTAG-TDO: Complete circuit (U1.40), Connectors (J6.7)
JTAG-TMS: Complete circuit (U1.17), Connectors (J6.4)
LDO-3V3: Complete circuit (U1.98), Conversion3V3 (B2.4 R29.1)
MCLR-P: Complete circuit (C1.1 R1.1 R2.1), Connectors (J6.2)
MGN-COMP: Complete circuit (U1.80), SEN/MGN-CurrSense (B7D.1 U5D.1)
MGN-CS: Complete circuit (U1.79), Sensors (B4.7)
MGN-EN: Complete circuit (U1.81), SEN/MGN-CurrSense (B7D.2 R58D.2)
MGN-MISO: Complete circuit (U1.77), Sensors (B4.2)
MGN-MOSI: Complete circuit (U1.78), Sensors (B4.3)
MGN_DRDY: Complete circuit (U1.82), Sensors (B4.6)
MGN_VSEN: Sensors (R48.2), SEN/MGN-CurrSense (B6D.1 Q1D.3)
MGTQ1-EN: Complete circuit (U1.22), FIL1 (R49A.1 U4A.5)
MGTQ1-FT: Complete circuit (U1.23), FIL1 (U4A.13)
MGTQ1-MODE: Complete circuit (U1.25), FIL1 (R53A.2 U4A.12)
MGTQ1-PWM: Complete circuit (U1.24), FIL1 (U4A.15)
MGTQ2-EN: Complete circuit (U1.29), FIL2 (R49B.1 U4B.5)
MGTQ2-FT: Complete circuit (U1.32), FIL2 (U4B.13)
MGTQ2-MODE: Complete circuit (U1.34), FIL2 (R53B.2 U4B.12)
MGTQ2-PWM: Complete circuit (U1.33), FIL2 (U4B.15)
MGTQ3-EN: Complete circuit (U1.87), FIL3 (R49C.1 U4C.5)
MGTQ3-FT: Complete circuit (U1.88), FIL3 (U4C.13)
MGTQ3-MODE: Complete circuit (U1.85), FIL3 (R53C.2 U4C.12)
MGTQ3-PWM: Complete circuit (U1.86), FIL3 (U4C.15)
MRAM-CLK: Complete circuit (U1.10), Memory (B9.6)
MRAM-COMP: Complete circuit (U1.4), MEM/MRAM-CurrSense (B7B.1 U5B.1)
MRAM-CS: Complete circuit (U1.7), Memory (B9.1 R74.1)
MRAM-EN: Complete circuit (U1.3), MEM/MRAM-CurrSense (B7B.2 R58B.2)
MRAM-HOLD: Complete circuit (U1.8), Memory (B9.7 R75.2)
MRAM-MISO: Complete circuit (U1.9), Memory (B9.2)
MRAM-MOSI: Complete circuit (U1.6), Memory (B9.5)
MRAM-VSEN: Memory (R73.2), MEM/MRAM-CurrSense (B6B.1 Q1B.3)
MRAM-WP: Complete circuit (U1.5), Memory (B9.3)
SPXM-SCL: Complete circuit (U1.12), Connectors (J3.4 R68.2)
SPXM-SDA: Complete circuit (U1.11), Connectors (J3.3 R66.2)
SPYM-SCL: Complete circuit (U1.65), Connectors (J5.4 R72.2)
SPYM-SDA: Complete circuit (U1.64), Connectors (J5.3 R70.2)
SPYP-SCL: Complete circuit (U1.59), Connectors (J4.4 R71.2)
SPYP-SDA: Complete circuit (U1.60), Connectors (J4.3 R69.2)
SPZP-SCL: Complete circuit (U1.58), Connectors (J2.4 R67.2)
SPZP-SDA: Complete circuit (U1.57), Connectors (J2.3 R65.2)
TEMP-MEAS: Complete circuit (U1.20), Sensors (B5.2)
XM-EN: Complete circuit (U1.97), Connectors (R77.2)
YM-EN: Complete circuit (U1.89), Connectors (R83.2)
YP-EN: Complete circuit (U1.61), Connectors (R82.2)
ZP-EN: Complete circuit (U1.35), Connectors (R76.2)